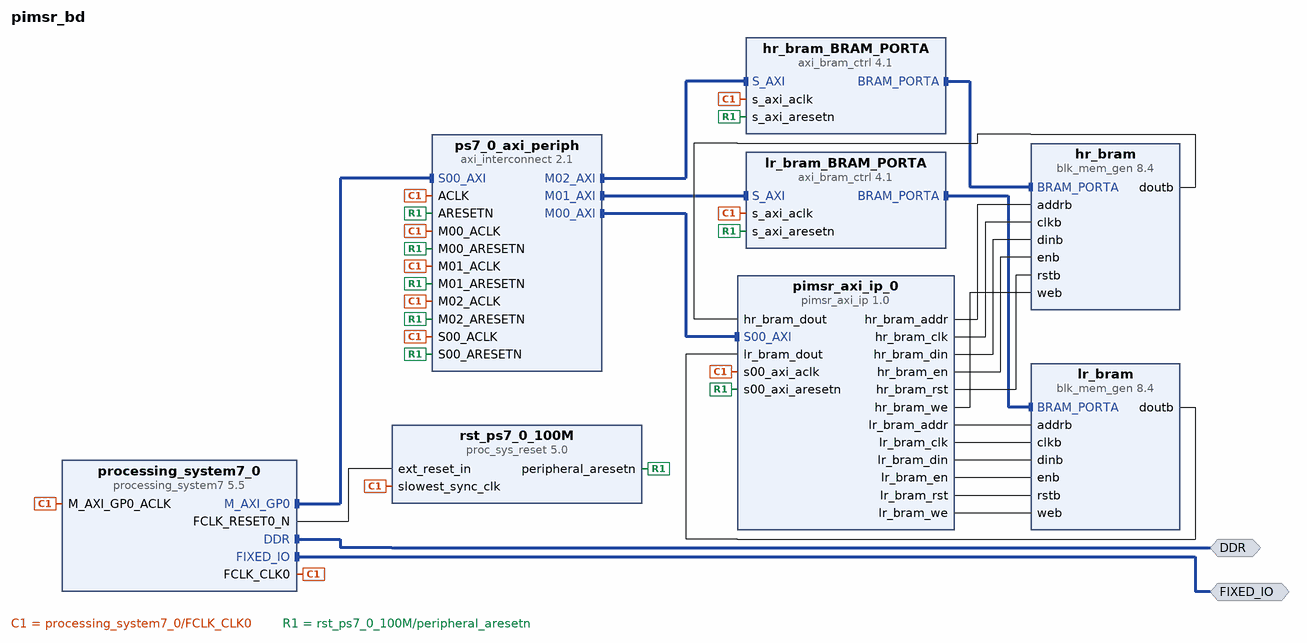
[diagram p0: block diagram of the top level]
# Vivado block design pimsr_bd, xc7z020clg400-1, Vivado 2022.2
create_bd_design pimsr_bd

create_bd_intf_port -mode Master -vlnv xilinx.com:interface:ddrx_rtl:1.0 DDR
create_bd_intf_port -mode Master -vlnv xilinx.com:display_processing_system7:fixedio_rtl:1.0 FIXED_IO

create_bd_cell -type ip -vlnv xilinx.com:ip:processing_system7:5.5 processing_system7_0
set_property -dict [list \
  CONFIG.PCW_APU_PERIPHERAL_FREQMHZ 650 \
  CONFIG.PCW_CRYSTAL_PERIPHERAL_FREQMHZ 50 \
  CONFIG.PCW_ENET0_ENET0_IO {MIO 16 .. 27} \
  CONFIG.PCW_ENET0_GRP_MDIO_ENABLE 1 \
  CONFIG.PCW_ENET0_GRP_MDIO_IO {MIO 52 .. 53} \
  CONFIG.PCW_ENET0_PERIPHERAL_ENABLE 1 \
  CONFIG.PCW_ENET0_RESET_ENABLE 1 \
  CONFIG.PCW_ENET0_RESET_IO {MIO 9} \
  CONFIG.PCW_ENET_RESET_ENABLE 1 \
  CONFIG.PCW_ENET_RESET_SELECT {Share reset pin} \
  CONFIG.PCW_FPGA0_PERIPHERAL_FREQMHZ 100 \
  CONFIG.PCW_FPGA1_PERIPHERAL_FREQMHZ 50 \
  CONFIG.PCW_GPIO_MIO_GPIO_ENABLE 1 \
  CONFIG.PCW_GPIO_MIO_GPIO_IO MIO \
  CONFIG.PCW_I2C_RESET_ENABLE 1 \
  CONFIG.PCW_M_AXI_GP0_FREQMHZ 10 \
  CONFIG.PCW_PERIPHERAL_BOARD_PRESET None \
  CONFIG.PCW_PRESET_BANK1_VOLTAGE {LVCMOS 1.8V} \
  CONFIG.PCW_QSPI_GRP_FBCLK_ENABLE 1 \
  CONFIG.PCW_QSPI_GRP_FBCLK_IO {MIO 8} \
  CONFIG.PCW_QSPI_GRP_SINGLE_SS_ENABLE 1 \
  CONFIG.PCW_QSPI_GRP_SINGLE_SS_IO {MIO 1 .. 6} \
  CONFIG.PCW_QSPI_PERIPHERAL_ENABLE 1 \
  CONFIG.PCW_QSPI_QSPI_IO {MIO 1 .. 6} \
  CONFIG.PCW_SD0_GRP_CD_ENABLE 1 \
  CONFIG.PCW_SD0_GRP_CD_IO {MIO 47} \
  CONFIG.PCW_SD0_GRP_WP_ENABLE 0 \
  CONFIG.PCW_SD0_PERIPHERAL_ENABLE 1 \
  CONFIG.PCW_SD0_SD0_IO {MIO 40 .. 45} \
  CONFIG.PCW_SDIO_PERIPHERAL_FREQMHZ 50 \
  CONFIG.PCW_SINGLE_QSPI_DATA_MODE x4 \
  CONFIG.PCW_UART0_PERIPHERAL_ENABLE 1 \
  CONFIG.PCW_UART0_UART0_IO {MIO 14 .. 15} \
  CONFIG.PCW_UART1_PERIPHERAL_ENABLE 0 \
  CONFIG.PCW_UART_PERIPHERAL_FREQMHZ 100 \
  CONFIG.PCW_UIPARAM_DDR_BUS_WIDTH {16 Bit} \
  CONFIG.PCW_UIPARAM_DDR_FREQ_MHZ 525 \
  CONFIG.PCW_UIPARAM_DDR_PARTNO {MT41J256M16 RE-125} \
  CONFIG.PCW_USB0_PERIPHERAL_ENABLE 1 \
  CONFIG.PCW_USB0_RESET_ENABLE 1 \
  CONFIG.PCW_USB0_RESET_IO {MIO 46} \
  CONFIG.PCW_USB0_USB0_IO {MIO 28 .. 39} \
  CONFIG.PCW_USB_RESET_ENABLE 1 \
  CONFIG.PCW_USB_RESET_SELECT {Share reset pin} \
] [get_bd_cells processing_system7_0]
# 481 more settings of processing_system7_0 are not shown: defaults, MIO pin electricals, DDR timing, and values the tool derives
create_bd_cell -type ip -vlnv xilinx.com:ip:axi_interconnect:2.1 ps7_0_axi_periph
set_property -dict {CONFIG.NUM_MI 3} [get_bd_cells ps7_0_axi_periph]
create_bd_cell -type ip -vlnv xilinx.com:ip:proc_sys_reset:5.0 rst_ps7_0_100M
create_bd_cell -type ip -vlnv xilinx.com:ip:blk_mem_gen:8.4 lr_bram
set_property -dict {CONFIG.Assume_Synchronous_Clk true CONFIG.Memory_Type True_Dual_Port_RAM} [get_bd_cells lr_bram]
create_bd_cell -type ip -vlnv xilinx.com:ip:blk_mem_gen:8.4 hr_bram
set_property -dict {CONFIG.Memory_Type True_Dual_Port_RAM} [get_bd_cells hr_bram]
create_bd_cell -type ip -vlnv xilinx.com:ip:axi_bram_ctrl:4.1 lr_bram_BRAM_PORTA
set_property -dict {CONFIG.SINGLE_PORT_BRAM 1} [get_bd_cells lr_bram_BRAM_PORTA]
create_bd_cell -type ip -vlnv xilinx.com:ip:axi_bram_ctrl:4.1 hr_bram_BRAM_PORTA
set_property -dict {CONFIG.SINGLE_PORT_BRAM 1} [get_bd_cells hr_bram_BRAM_PORTA]
create_bd_cell -type ip -vlnv xilinx.com:user:pimsr_axi_ip:1.0 pimsr_axi_ip_0
set_property -dict {CONFIG.IMG_H 45 CONFIG.IMG_W 45} [get_bd_cells pimsr_axi_ip_0]

# ---- connections ----

connect_bd_intf_net [get_bd_intf_pins hr_bram_BRAM_PORTA/BRAM_PORTA] [get_bd_intf_pins hr_bram/BRAM_PORTA]
connect_bd_intf_net [get_bd_intf_pins lr_bram_BRAM_PORTA/BRAM_PORTA] [get_bd_intf_pins lr_bram/BRAM_PORTA]
connect_bd_intf_net [get_bd_intf_ports DDR] [get_bd_intf_pins processing_system7_0/DDR]
connect_bd_intf_net [get_bd_intf_ports FIXED_IO] [get_bd_intf_pins processing_system7_0/FIXED_IO]
connect_bd_intf_net [get_bd_intf_pins processing_system7_0/M_AXI_GP0] [get_bd_intf_pins ps7_0_axi_periph/S00_AXI]
connect_bd_intf_net [get_bd_intf_pins ps7_0_axi_periph/M00_AXI] [get_bd_intf_pins pimsr_axi_ip_0/S00_AXI]
connect_bd_intf_net [get_bd_intf_pins ps7_0_axi_periph/M01_AXI] [get_bd_intf_pins lr_bram_BRAM_PORTA/S_AXI]
connect_bd_intf_net [get_bd_intf_pins hr_bram_BRAM_PORTA/S_AXI] [get_bd_intf_pins ps7_0_axi_periph/M02_AXI]
connect_bd_net [get_bd_pins hr_bram/doutb] [get_bd_pins pimsr_axi_ip_0/hr_bram_dout]
connect_bd_net [get_bd_pins lr_bram/doutb] [get_bd_pins pimsr_axi_ip_0/lr_bram_dout]
connect_bd_net [get_bd_pins pimsr_axi_ip_0/hr_bram_addr] [get_bd_pins hr_bram/addrb]
connect_bd_net [get_bd_pins pimsr_axi_ip_0/hr_bram_clk] [get_bd_pins hr_bram/clkb]
connect_bd_net [get_bd_pins pimsr_axi_ip_0/hr_bram_din] [get_bd_pins hr_bram/dinb]
connect_bd_net [get_bd_pins pimsr_axi_ip_0/hr_bram_en] [get_bd_pins hr_bram/enb]
connect_bd_net [get_bd_pins pimsr_axi_ip_0/hr_bram_rst] [get_bd_pins hr_bram/rstb]
connect_bd_net [get_bd_pins pimsr_axi_ip_0/hr_bram_we] [get_bd_pins hr_bram/web]
connect_bd_net [get_bd_pins pimsr_axi_ip_0/lr_bram_addr] [get_bd_pins lr_bram/addrb]
connect_bd_net [get_bd_pins pimsr_axi_ip_0/lr_bram_clk] [get_bd_pins lr_bram/clkb]
connect_bd_net [get_bd_pins pimsr_axi_ip_0/lr_bram_din] [get_bd_pins lr_bram/dinb]
connect_bd_net [get_bd_pins pimsr_axi_ip_0/lr_bram_en] [get_bd_pins lr_bram/enb]
connect_bd_net [get_bd_pins pimsr_axi_ip_0/lr_bram_rst] [get_bd_pins lr_bram/rstb]
connect_bd_net [get_bd_pins pimsr_axi_ip_0/lr_bram_we] [get_bd_pins lr_bram/web]
connect_bd_net [get_bd_pins processing_system7_0/FCLK_CLK0] \
  [get_bd_pins processing_system7_0/M_AXI_GP0_ACLK] [get_bd_pins ps7_0_axi_periph/S00_ACLK] \
  [get_bd_pins rst_ps7_0_100M/slowest_sync_clk] [get_bd_pins ps7_0_axi_periph/M00_ACLK] [get_bd_pins ps7_0_axi_periph/ACLK] \
  [get_bd_pins ps7_0_axi_periph/M01_ACLK] [get_bd_pins ps7_0_axi_periph/M02_ACLK] [get_bd_pins lr_bram_BRAM_PORTA/s_axi_aclk] \
  [get_bd_pins hr_bram_BRAM_PORTA/s_axi_aclk] [get_bd_pins pimsr_axi_ip_0/s00_axi_aclk]
connect_bd_net [get_bd_pins processing_system7_0/FCLK_RESET0_N] [get_bd_pins rst_ps7_0_100M/ext_reset_in]
connect_bd_net [get_bd_pins rst_ps7_0_100M/peripheral_aresetn] \
  [get_bd_pins ps7_0_axi_periph/S00_ARESETN] [get_bd_pins ps7_0_axi_periph/M00_ARESETN] \
  [get_bd_pins ps7_0_axi_periph/ARESETN] [get_bd_pins ps7_0_axi_periph/M01_ARESETN] \
  [get_bd_pins ps7_0_axi_periph/M02_ARESETN] [get_bd_pins hr_bram_BRAM_PORTA/s_axi_aresetn] \
  [get_bd_pins lr_bram_BRAM_PORTA/s_axi_aresetn] [get_bd_pins pimsr_axi_ip_0/s00_axi_aresetn]
set_property HDL_ATTRIBUTE.BMM_INFO_PROCESSOR {arm > pimsr_bd hr_bram_BRAM_PORTA pimsr_bd lr_bram_BRAM_PORTA} [get_bd_cells processing_system7_0]
set_property HDL_ATTRIBUTE.KEEP_HIERARCHY yes [get_bd_cells processing_system7_0]
set_property HDL_ATTRIBUTE.BMM_INFO_ADDRESS_SPACE {byte  0x42000000 32 > pimsr_bd lr_bram} [get_bd_cells lr_bram_BRAM_PORTA]
set_property HDL_ATTRIBUTE.KEEP_HIERARCHY yes [get_bd_cells lr_bram_BRAM_PORTA]
set_property HDL_ATTRIBUTE.BMM_INFO_ADDRESS_SPACE {byte  0x40000000 32 > pimsr_bd hr_bram} [get_bd_cells hr_bram_BRAM_PORTA]
set_property HDL_ATTRIBUTE.KEEP_HIERARCHY yes [get_bd_cells hr_bram_BRAM_PORTA]

# ---- address map ----
assign_bd_address -offset 0x40000000 -range 8K -target_address_space [get_bd_addr_spaces processing_system7_0/Data] [get_bd_addr_segs hr_bram_BRAM_PORTA/S_AXI/Mem0]
assign_bd_address -offset 0x42000000 -range 8K -target_address_space [get_bd_addr_spaces processing_system7_0/Data] [get_bd_addr_segs lr_bram_BRAM_PORTA/S_AXI/Mem0]
assign_bd_address -offset 0x43C00000 -range 64K -target_address_space [get_bd_addr_spaces processing_system7_0/Data] [get_bd_addr_segs pimsr_axi_ip_0/S00_AXI/S00_AXI_reg]

validate_bd_design
save_bd_design
